# Altium schematic sheet DIO_8SMA_8MC.SchDoc: =DocumentName
size A4; DocumentNumber: 1; Revision: 0; SheetNumber: 1; SheetTotal: 17
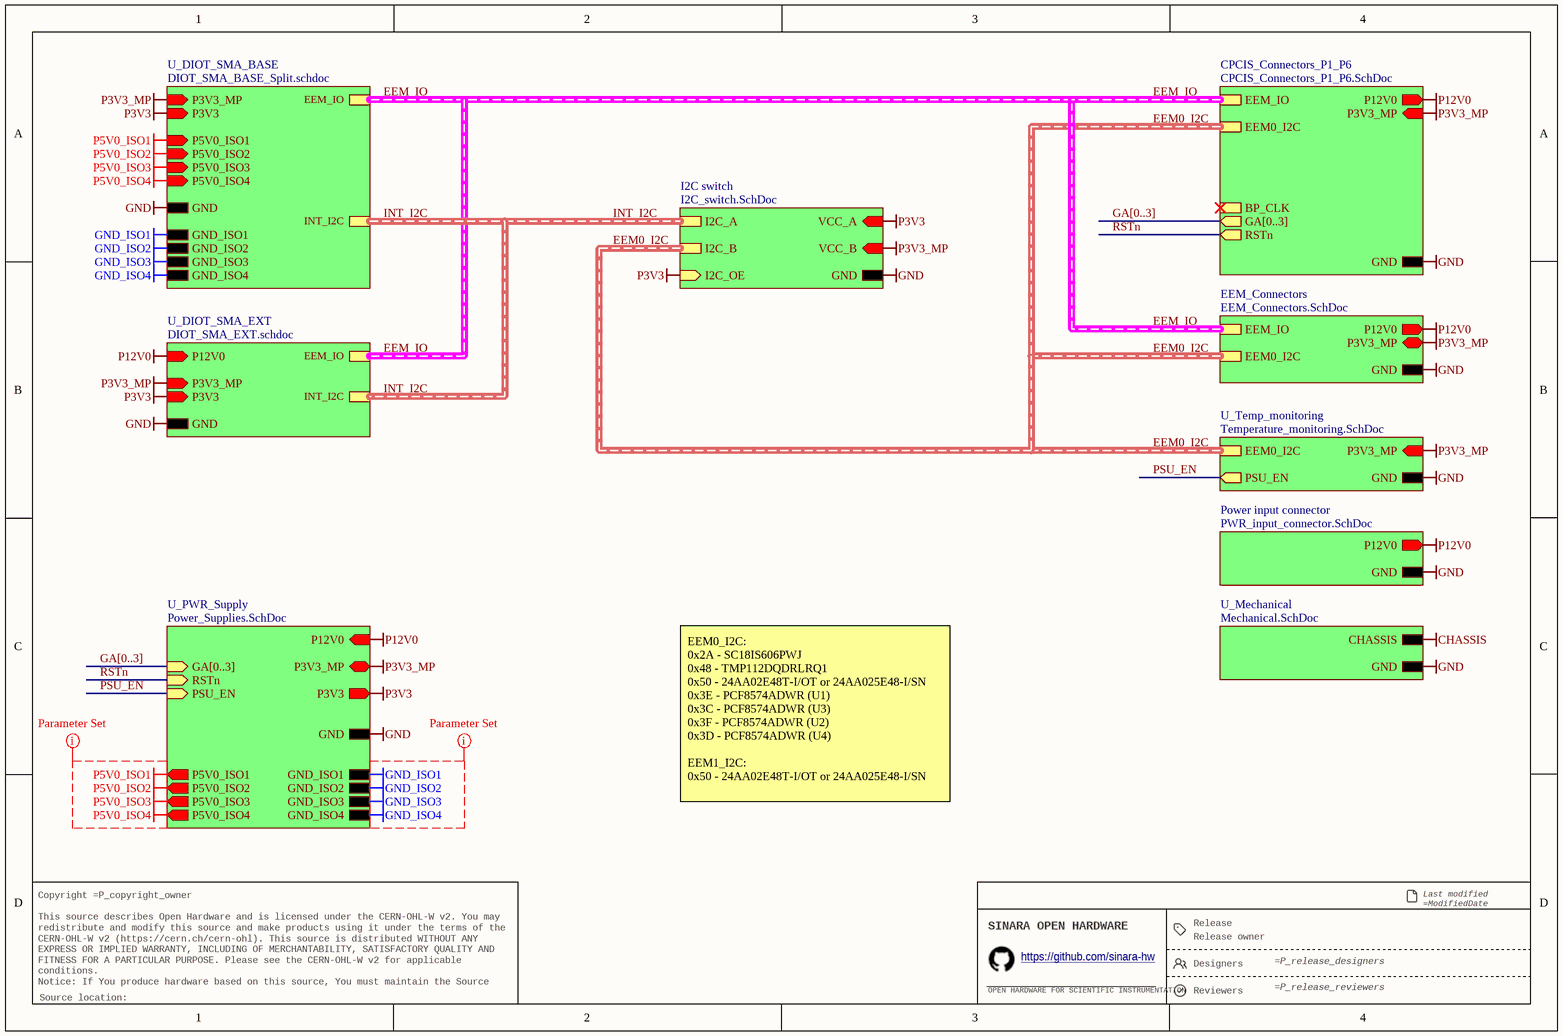
[diagram p0: DIO_8SMA_8MC.SchDoc]

## Sub-sheets
CPCIS_Connectors_P1_P6 = CPCIS_Connectors_P1_P6.SchDoc: P12V0 (out), P3V3_MP (in), EEM_IO (harness EEM_LVDS), EEM0_I2C (harness I2C), GA[0..3] (out), GND, RSTn (out), BP_CLK (harness CLK_DIFF)
EEM_Connectors = EEM_Connectors.SchDoc: P3V3_MP (bidir), P12V0 (out), EEM_IO (harness EEM_LVDS), EEM0_I2C (harness I2C), GND
I2C switch = I2C_switch.SchDoc: I2C_A (harness I2C), I2C_B (harness I2C), I2C_OE (in), GND, VCC_A (in), VCC_B (in)
Power input connector = PWR_input_connector.SchDoc: P12V0 (out), GND
U_DIOT_SMA_BASE = DIOT_SMA_BASE_Split.schdoc: EEM_IO (harness EEM_LVDS), GND_ISO4, GND_ISO3, GND_ISO2, GND_ISO1, GND, P5V0_ISO4 (in), P5V0_ISO3 (in), P5V0_ISO2 (in), P5V0_ISO1 (in), P3V3_MP (in), P3V3 (in), INT_I2C (harness I2C)
U_DIOT_SMA_EXT = DIOT_SMA_EXT.schdoc: EEM_IO (harness EEM_LVDS), INT_I2C (harness I2C), P3V3 (in), P3V3_MP (in), P12V0 (in), GND
U_Mechanical = Mechanical.SchDoc: CHASSIS, GND
U_PWR_Supply = Power_Supplies.SchDoc: GND, P12V0 (in), P3V3 (out), P3V3_MP (bidir), GA[0..3] (in), RSTn (in), PSU_EN (in), P5V0_ISO1 (out), P5V0_ISO2 (out), P5V0_ISO3 (out), P5V0_ISO4 (out), GND_ISO1, GND_ISO2, GND_ISO3, GND_ISO4
U_Temp_monitoring = Temperature_monitoring.SchDoc: GND, P3V3_MP (in), EEM0_I2C (harness I2C), PSU_EN (out)

## Nets
CHASSIS: sheet U_Mechanical/CHASSIS
GND: sheet U_PWR_Supply/GND, sheet CPCIS_Connectors_P1_P6/GND, sheet EEM_Connectors/GND, sheet U_Temp_monitoring/GND, sheet Power input connector/GND, sheet U_Mechanical/GND, sheet I2C switch/GND, sheet U_DIOT_SMA_BASE/GND, sheet U_DIOT_SMA_EXT/GND
GND_ISO1: sheet U_PWR_Supply/GND_ISO1, sheet U_DIOT_SMA_BASE/GND_ISO1
GND_ISO2: sheet U_PWR_Supply/GND_ISO2, sheet U_DIOT_SMA_BASE/GND_ISO2
GND_ISO3: sheet U_PWR_Supply/GND_ISO3, sheet U_DIOT_SMA_BASE/GND_ISO3
GND_ISO4: sheet U_PWR_Supply/GND_ISO4, sheet U_DIOT_SMA_BASE/GND_ISO4
P3V3: sheet U_PWR_Supply/P3V3, sheet I2C switch/I2C_OE, sheet I2C switch/VCC_A, sheet U_DIOT_SMA_BASE/P3V3, sheet U_DIOT_SMA_EXT/P3V3
P3V3_MP: sheet U_PWR_Supply/P3V3_MP, sheet CPCIS_Connectors_P1_P6/P3V3_MP, sheet EEM_Connectors/P3V3_MP, sheet U_Temp_monitoring/P3V3_MP, sheet I2C switch/VCC_B, sheet U_DIOT_SMA_BASE/P3V3_MP, sheet U_DIOT_SMA_EXT/P3V3_MP
P5V0_ISO1: sheet U_PWR_Supply/P5V0_ISO1, sheet U_DIOT_SMA_BASE/P5V0_ISO1
P5V0_ISO2: sheet U_PWR_Supply/P5V0_ISO2, sheet U_DIOT_SMA_BASE/P5V0_ISO2
P5V0_ISO3: sheet U_PWR_Supply/P5V0_ISO3, sheet U_DIOT_SMA_BASE/P5V0_ISO3
P5V0_ISO4: sheet U_PWR_Supply/P5V0_ISO4, sheet U_DIOT_SMA_BASE/P5V0_ISO4
P12V0: sheet U_PWR_Supply/P12V0, sheet CPCIS_Connectors_P1_P6/P12V0, sheet EEM_Connectors/P12V0, sheet Power input connector/P12V0, sheet U_DIOT_SMA_EXT/P12V0
PSU_EN: sheet U_PWR_Supply/PSU_EN, sheet U_Temp_monitoring/PSU_EN
RSTn: sheet U_PWR_Supply/RSTn, sheet CPCIS_Connectors_P1_P6/RSTn

## Buses and harness runs
bus GA[0..3] = sheet CPCIS_Connectors_P1_P6/GA[0..3]
bus GA[0..3] = sheet U_PWR_Supply/GA[0..3]
harness EEM0_I2C = sheet CPCIS_Connectors_P1_P6/EEM0_I2C = sheet EEM_Connectors/EEM0_I2C = sheet I2C switch/I2C_B = sheet U_Temp_monitoring/EEM0_I2C
harness EEM_IO = sheet CPCIS_Connectors_P1_P6/EEM_IO = sheet EEM_Connectors/EEM_IO = sheet U_DIOT_SMA_BASE/EEM_IO = sheet U_DIOT_SMA_EXT/EEM_IO
harness INT_I2C = sheet I2C switch/I2C_A = sheet U_DIOT_SMA_BASE/INT_I2C = sheet U_DIOT_SMA_EXT/INT_I2C

## Layout directives
net class GND_ISO: GND_ISO1, GND_ISO2, GND_ISO3, GND_ISO4
net class PWR_ISO: P5V0_ISO1, P5V0_ISO2, P5V0_ISO3, P5V0_ISO4

## Notes on the sheet
- EEM0_I2C:
  0x2A - SC18IS606PWJ
  0x48 - TMP112DQDRLRQ1
  0x50 - 24AA02E48T-I/OT or 24AA025E48-I/SN
  0x3E - PCF8574ADWR (U1)
  0x3C - PCF8574ADWR (U3)
  0x3F - PCF8574ADWR (U2)
  0x3D - PCF8574ADWR (U4)
  EEM1_I2C:
  0x50 - 24AA02E48T-I/OT or 24AA025E48-I/SN
- Release
- Last modified =ModifiedDate
  Sheet =sheetnumber of =sheettotal · Size A4
- Copyright =P_copyright_owner
  This source describes Open Hardware and is licensed under the CERN-OHL-W v2. You may redistribute and modify this source and make products using it under the terms of the CERN-OHL-W v2 (https://cern.ch/cern-ohl). This source is distributed WITHOUT ANY EXPRESS OR IMPLIED WARRANTY, INCLUDING OF MERCHANTABILITY, SATISFACTORY QUALITY AND FITNESS FOR A PARTICULAR PURPOSE. Please see the CERN-OHL-W v2 for applicable conditions.
  Notice: If You produce hardware based on this source, You must maintain the Source Location visible on the product, its packaging or its documentation.
- SINARA OPEN HARDWARE
- OPEN HARDWARE FOR SCIENTIFIC INSTRUMENTATION
- https://github.com/sinara-hw
- Release owner
- Designers
- Reviewers
- Source location: